# EasyEDA Pro project car.epro, schematic Schematic1
Create Date: 2022-11-29; Page Name: P1; Project Name: STM32F103开发板-板载stlink; Schematic Name: Schematic1; Update Date: 2022-12-02; Company: 嘉立创EDA; Page Size: A3; Version: V1.0
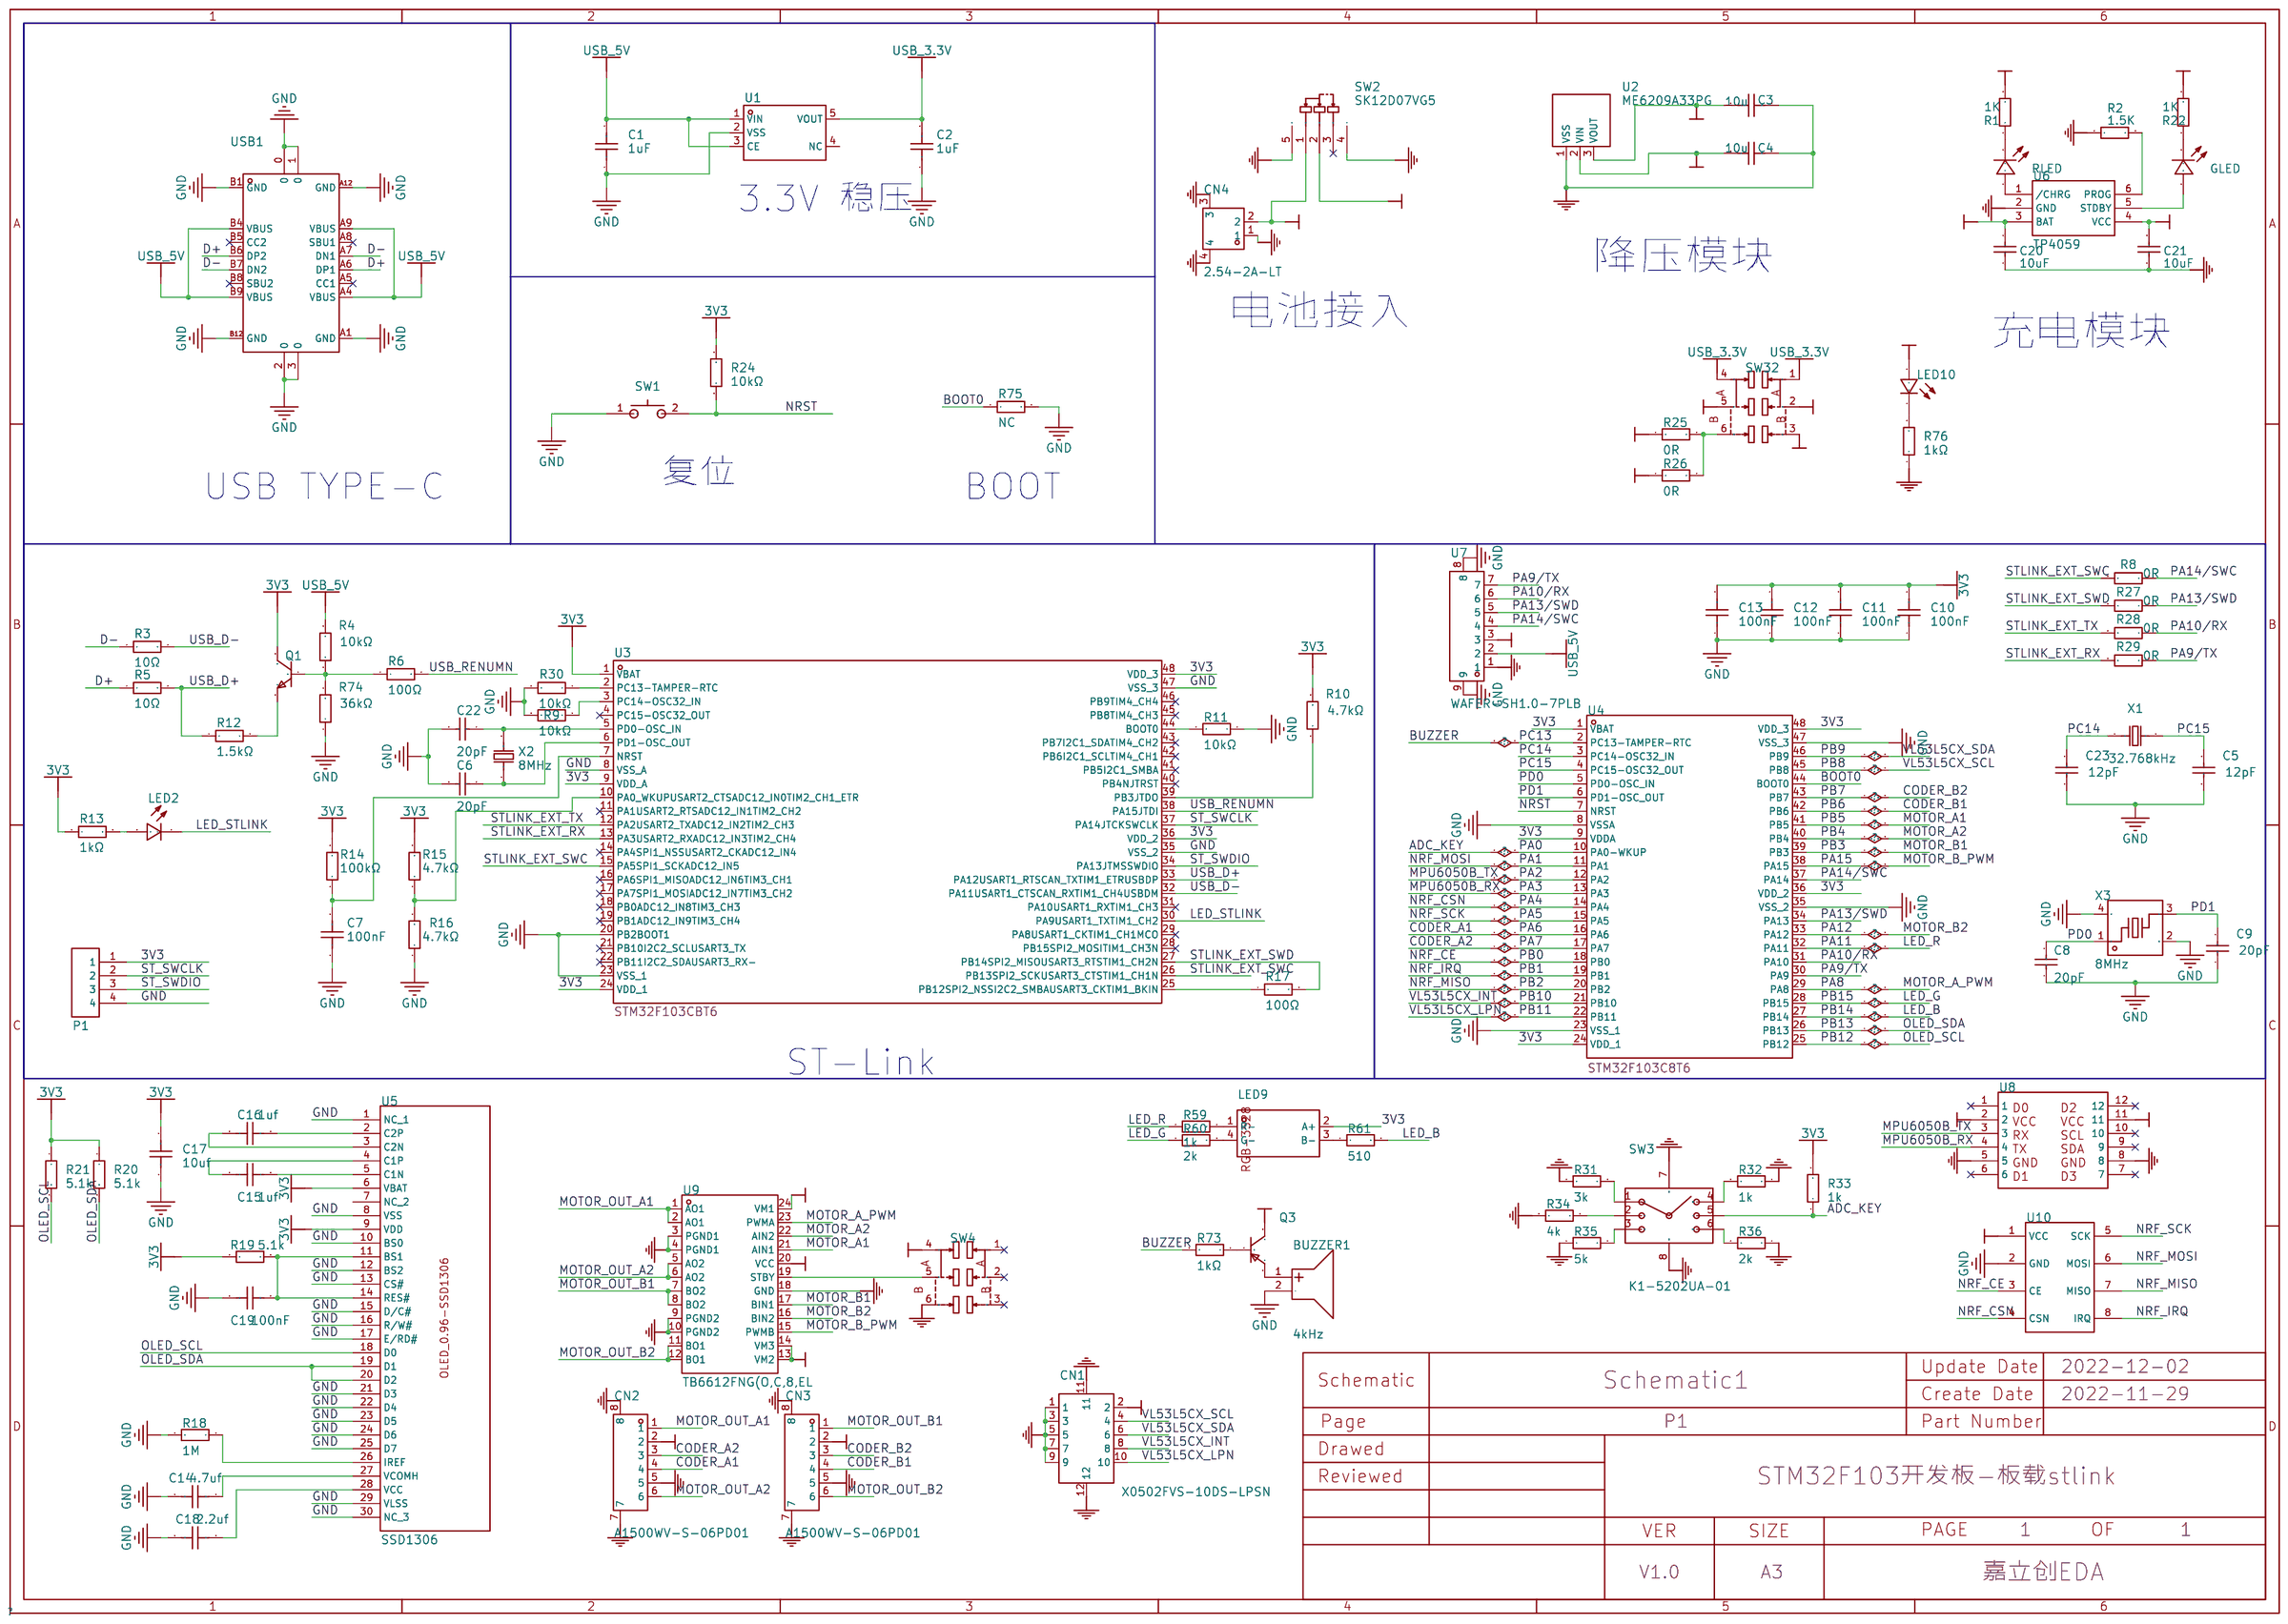
[diagram p0: schematic sheet]

## Parts
BUZZER1  4kHz  [BUZ-SMD_2P-L4.0-W4.0-L_GSC4317YA]
C1  1uF  [C0402]
C2  1uF  [C0402]
C3  10u  [C0603]
C4  10u  [C0603]
C5  12pF  [C0402]
C6  20pF  [C0402]
C7  100nF  [C0402]
C8  20pF  [C0402]
C9  20pF  [C0402]
C10  100nF  [C0402]
C11  100nF  [C0402]
C12  100nF  [C0402]
C13  100nF  [C0402]
C14  4.7uf  [C0402]
C15  1uf  [C0402]
C16  1uf  [C0402]
C17  10uf  [C0603_1]
C18  2.2uf  [C0402]
C19  100nF  [C0402]
C20  10uF  [C0603]
C21  10uF  [C0603]
C22  20pF  [C0402]
C23  12pF  [C0402]
CN1  X0502FVS-10DS-LPSN  [CONN-SMD_10P-P0.50_X0502FVS-10DS-LPSN]
CN2  A1500WV-S-06PD01  [CONN-SMD_6P-P1.50_A1500WV-S-06PD01]
CN3  A1500WV-S-06PD01  [CONN-SMD_6P-P1.50_A1500WV-S-06PD01]
CN4  2.54-2A-LT  [CONN-SMD_2P-P2.54_XH2.54-2AB]
GLED  ORH-G36G  [LED0603-RD]
LED2  NCD0603Y1  [LED0603-RD]
LED9  LED-RGB-3528  [LED 3528-4PIN]
LED10  -  [LED0603-RD]
P1  -  [1.27-4P烧录孔]  (no BOM)
Q1  S8050 J3Y  [SOT-23-3_L3.0-W1.7-P0.95-LS2.9-BR]
Q3  S8550  [SOT-23-3_L2.9-W1.3-P1.90-LS2.4-BR]
R1  1K  [R0402]
R2  1.5K  [R0402]
R3  10Ω  [R0402]
R4  10kΩ  [R0402]
R5  10Ω  [R0402]
R6  100Ω  [R0402]
R8  0R  [R0402]
R9  10kΩ  [R0402]
R10  4.7kΩ  [R0402]
R11  10kΩ  [R0402]
R12  1.5kΩ  [R0402]
R13  1kΩ  [R0402]
R14  100kΩ  [R0402]
R15  4.7kΩ  [R0402]
R16  4.7kΩ  [R0402]
R17  100Ω  [R0402]
R18  1M  [R0402]
R19  5.1k  [R0402]
R20  5.1k  [R0402]
R21  5.1k  [R0402]
R22  1K  [R0402]
R24  10kΩ  [R0402]
R25  0R  [R0603]
R26  0R  [R0603]
R27  0R  [R0402]
R28  0R  [R0402]
R29  0R  [R0402]
R30  10kΩ  [R0402]
R31  3k  [R0402]
R32  1k  [R0402]
R33  1k  [R0402]
R34  4k  [R0402]
R35  5k  [R0402]
R36  2k  [R0402]
R59  1k  [R0402]
R60  2k  [R0402]
R61  510  [R0402]
R73  1kΩ  [R0402]
R74  36kΩ  [R0402]
R75  NC  [R0402]
R76  1kΩ  [R0402]
RLED  ORH-G36G  [LED0603-RD]
SW1  -  [SW-SMD_L3.9-W2.9-P4.15-LS5.0]
SW2  SK12D07VG5  [SW-TH_SK12D07VG5-1]
SW3  K1-5202UA-01  [SW-SMD_K1-5202UA-01]
SW4  MST22D18G2  [SW-SMD_MST22D18G2]
SW32  MST22D18G2  [SW-SMD_MST22D18G2]
U1  XC6210B332MR  [SOT-25_L3.0-W1.6-P0.95-LS2.8-BL]
U2  ME6209A33PG  [SOT-89-3_L4.5-W2.5-P1.50-LS4.2-BR]
U3  STM32F103CBT6  [LQFP-48_L7.0-W7.0-P0.50-LS9.0-BL]
U4  -  [LQFP-48_L7.0-W7.0-P0.50-LS9.0-BL]
U5  SSD1306  [1.3OLED-2]
U6  TP4059  [SOT-23-6_L2.9-W1.6-P0.95-LS2.8-BR]
U7  WAFER-SH1.0-7PLB  [CONN-SMD_7P-P1.00_HC-1.0-7PLT]
U8  -  [JY901S]
U9  TB6612FNG(O,C,8,EL  [SSOP-24_L8.4-W5.8-P0.65-LS7.8-BL]
U10  -  [nrf24f01贴片模块]
USB1  -  [USB-C_SMD-TYPE-C-31-M-12]
X1  32.768kHz  [FC-135R_L3.2-W1.5]
X2  8MHz  [CRYSTAL-SMD_L3.2-W1.5-FC-135R32.7680KF-A3]
X3  8MHz  [CRYSTAL-SMD_4P-L3.2-W2.5-BL]

## Library data of the parts
BUZZER1 = GSC4417YA-16R4000: 驱动方式:无源(外部驱动);构造类型:电磁式;频率:4kHz;声压(SPL):70dB;; LCSC Part Name: 贴片式电磁无源蜂鸣器（外部驱动）; Supplier Part: C255308; Manufacturer: INGHAi(赢海); JLCPCB Part Class: 扩展库; Datasheet: https://item.szlcsc.com/datasheet/GSC4417YA-16R4000/249260.html; Supplier: LCSC; Driver Circuitry: 无源(外部驱动); Technology: 电磁式; Voltage - Supply: 2V~4V; Sound Pressure Level(SPL): 70dB; Length: 4mm; Width: 4mm; Height: 2mm
C1 C2 = CL05A105KA5NQNC: 容值:1uF;精度:±10%;额定电压:25V;材质(温度系数):X5R;; LCSC Part Name: 1uF ±10% 25V; Supplier Part: C52923; Manufacturer: SAMSUNG(三星); Supplier Footprint: 0402; JLCPCB Part Class: Basic Part; Datasheet: https://atta.szlcsc.com/upload/public/pdf/source/20160103/1457707735223.pdf; Supplier: LCSC; Tolerance: ±10%; Voltage Rated: 25V; Temperature Coefficient: X5R
C3 C4 = 10u
C5 C23 = 0402CG120J500NT: 容值:12pF;精度:±5%;额定电压:50V;材质(温度系数):C0G;; LCSC Part Name: 12pF ±5% 50V; Supplier Part: C1547; Manufacturer: FH(风华); Supplier Footprint: 0402; JLCPCB Part Class: Basic Part; Datasheet: https://atta.szlcsc.com/upload/public/pdf/source/20170923/C1547_1506149265711988354.pdf; Supplier: LCSC; Tolerance: ±5%; Voltage Rated: 50V; Temperature Coefficient: C0G
C6 C8 C9 C22 = 0402CG200J500NT: 容值:20pF;精度:±5%;额定电压:50V;材质(温度系数):C0G;; LCSC Part Name: 20pF ±5% 50V; Supplier Part: C1554; Manufacturer: FH(风华); Supplier Footprint: 0402; JLCPCB Part Class: Basic Part; Datasheet: https://atta.szlcsc.com/upload/public/pdf/source/20170923/C1554_1506149268708988361.pdf; Supplier: LCSC; Tolerance: ±5%; Voltage Rated: 50V; Temperature Coefficient: C0G
C7 C10-C13 = CL05B104KB54PNC: 容值:100nF;精度:±10%;额定电压:50V;材质(温度系数):X7R;; LCSC Part Name: 100nF ±10% 50V; Supplier Part: C307331; Manufacturer: SAMSUNG(三星); Supplier Footprint: 0402; JLCPCB Part Class: Basic Part; Datasheet: https://atta.szlcsc.com/upload/public/pdf/source/20181009/C307331_222F7C870FD3EA5F46F538B483443886.pdf; Supplier: LCSC; Tolerance: ±10%; Voltage Rated: 50V; Temperature Coefficient: X7R
C14-C19 = CAP_0603: Supplier Footprint: 0603
C20 C21 = GRM21BB31C106KE15L: Supplier: LCSC; Supplier Part: C162317; Manufacturer: Murata Electronics
CN1 = X0502FVS-10DS-LPSN: PIN总数:10P;间距:0.5mm;安装方式:立贴;排数:2;额定电流:300mA;工作温度:-40℃~+125℃;; LCSC Part Name: PIN:10P 间距:0.5mm 立贴; Supplier Part: C21261238; Manufacturer: XKB Connection(中国星坤); Supplier Footprint: SMD,P=0.5mm; JLCPCB Part Class: Extended Part; Datasheet: https://item.szlcsc.com/datasheet/X0502FVS-10DS-LPSN/22679970.html; Supplier: LCSC; Number of Pins: 10P; Pitch: 0.5mm; Mounting Type: 立贴; Number of Rows: 2; Current Rating: 300mA; Voltage Rating: 100V; Connection Type: 槽型对接; Contact Material: 铜合金; Operating Temperature: -40℃~+125℃
CN2 CN3 = A1500WV-S-06PD01: 插针结构:1x6P;间距:1.5mm;安装方式:立贴;参考系列:-;总PIN数:6P;排数:1;每排PIN数:6;行距:-;额定电流:1A;触头材质:黄铜;触头镀层:金;工作温度:-25℃~+85℃;; LCSC Part Name: 1x6P 间距:1.5mm 立贴; Supplier Part: C360124; Manufacturer: HR(灿达); Supplier Footprint: SMD,P=1.5mm; JLCPCB Part Class: Extended Part; Datasheet: https://item.szlcsc.com/datasheet/A1500WV-S-06PD01/334902.html; Supplier: LCSC; Pins Structure: 1x6P; Pitch: 1.5mm; Mounting Type: 立贴; Number of Pins: 6P; Number of Rows: 1; Number of PINs Per Row: 6; Current Rating: 1A; Contact Material: 黄铜; Contact Plating: 金; Operating Temperature: -25℃~+85℃; Voltage Rating: 100V; Plastic Material: PA6T; Flame Retardant Rating: UL94V-0; Color: 米色; Z-Height of the Board: 6.5mm; Y-Width of Bottom Edge on Board: 4.1mm
CN4 = 2.54-2A-LT: 插针结构:1x2P;间距:2.54mm;安装方式:立贴;参考系列:XH;总PIN数:2P;排数:1;每排PIN数:2;行距:-;额定电流:500mA;触头材质:磷铜;触头镀层:锡;工作温度:-25℃~+85℃;; LCSC Part Name: 1x2P 间距:2.54mm 立贴 系列:XH; Supplier Part: C722695; Manufacturer: CAX(创都); Supplier Footprint: SMD,P=2.54mm; JLCPCB Part Class: Extended Part; Datasheet: https://item.szlcsc.com/datasheet/2.54-2A-LT/766902.html; Supplier: LCSC; Pins Structure: 1x2P; Pitch: 2.54mm; Mounting Type: 立贴; Reference Series: XH; Number of Pins: 2P; Number of Rows: 1; Number of PINs Per Row: 2; Current Rating: 500mA; Contact Material: 磷铜; Contact Plating: 锡; Operating Temperature: -25℃~+85℃; Voltage Rating: 50V; Plastic Material: LCP; Color: 米色; Z-Height of the Board: 7.9mm; Y-Width of Bottom Edge on Board: 6mm
GLED RLED = ORH-G36G: Supplier: LCSC; Supplier Part: C205443; Manufacturer: Orient; JLCPCB Part Class: Extend
LED2 = NCD0603Y1: 发光颜色:黄灯;; LCSC Part Name: 黄灯; Supplier Part: C84268; Manufacturer: 国星光电; Supplier Footprint: 0603; JLCPCB Part Class: Extended Part; Datasheet: https://atta.szlcsc.com/upload/public/pdf/source/20200820/C84268_8FC106CB292CF978F9CFC6892464F83C.pdf; Supplier: LCSC; Emitted Color: 黄灯
LED9 = ?
LED10 = NCD0603G1: 发光颜色:翠绿;; LCSC Part Name: 翠绿; Supplier Part: C84267; Manufacturer: 国星光电; Supplier Footprint: 0603; JLCPCB Part Class: Extended Part; Datasheet: https://atta.szlcsc.com/upload/public/pdf/source/20200820/C84267_04BA7703640BAC111D09F5EFB971FBF3.pdf; Supplier: LCSC; Emitted Color: 翠绿
P1 = 1.27-4P烧录孔
Q1 = S8050 J3Y: 晶体管类型:NPN;集射极击穿电压(Vceo):25V;集电极电流(Ic):500mA;功率(Pd):300mW;集电极-发射极饱和电压(VCE(sat)@Ic,Ib):600mV@500mA,50mA;直流电流增益(hFE@Ic,Vce):200@50mA,1V;特征频率(fT):150MHz;工作温度:+150@(Tj);; LCSC Part Name: S8050 J3Y (200-350) (200-350); Supplier Part: C2146; Manufacturer: CJ（江苏长电/长晶）; Supplier Footprint: SOT-23(SOT-23-3); JLCPCB Part Class: Basic Part; Datasheet: https://atta.szlcsc.com/upload/public/pdf/source/20140809/1457707209234.pdf; Supplier: LCSC; Transistor Type: NPN; Collector-Emitter Breakdown Voltage (Vceo): 25V; Collector Current (Ic): 500mA; Power Dissipation (Pd): 300mW; Collector-Emitter Saturation Voltage (VCE(sat)@Ic,Ib): 600mV@500mA,50mA; DC Current Gain (hFE@Ic,Vce): 200@50mA,1V; Transition Frequency (fT): 150MHz; Operating Temperature: +150@(Tj)
Q3 = S8550_C2891805: Supplier Part: C2891805; Manufacturer: YONGYUTAI(永裕泰); Supplier Footprint: SOT-23; JLCPCB Part Class: 扩展库; Datasheet: https://atta.szlcsc.com/upload/public/pdf/source/20210901/65C3C4D1695A9271DEFEFE0B623CB3B1.pdf; Supplier: LCSC
R1 R2 R22 = RC0603FR-071K5L: Supplier: LCSC; Manufacturer: YAGEO; Supplier Part: C114668
R3 R5 = 0402WGF100JTCE: 电阻类型:厚膜电阻;阻值:10Ω;精度:±1%;功率:62.5mW;温度系数:±200ppm/;最大工作电压:50V;工作温度范围:-55~+155;; LCSC Part Name: 10Ω ±1% 62.5mW; Supplier Part: C25077; Manufacturer: UNI-ROYAL(厚声); Supplier Footprint: 0402; JLCPCB Part Class: Basic Part; Datasheet: https://atta.szlcsc.com/upload/public/pdf/source/20200306/C422600_1E6D84923E4A46A82E41ADD87F860B5C.pdf; Supplier: LCSC; Type: 厚膜电阻; Tolerance: ±1%; Power(Watts): 62.5mW; Temperature Coefficient: ±200ppm/; Overload Voltage (Max): 50V; Operating Temperature Range: -55~+155
R4 R8 R9 R11 R24 R27-R30 R74 = 0402WGF1002TCE: 电阻类型:厚膜电阻;阻值:10kΩ;精度:±1%;功率:62.5mW;温度系数:±100ppm/;最大工作电压:50V;工作温度范围:-55~+155;; LCSC Part Name: 10kΩ ±1% 62.5mW; Supplier Part: C25744; Manufacturer: UNI-ROYAL(厚声); Supplier Footprint: 0402; JLCPCB Part Class: Basic Part; Datasheet: https://atta.szlcsc.com/upload/public/pdf/source/20200306/C422600_1E6D84923E4A46A82E41ADD87F860B5C.pdf; Supplier: LCSC; Type: 厚膜电阻; Tolerance: ±1%; Power(Watts): 62.5mW; Temperature Coefficient: ±100ppm/; Overload Voltage (Max): 50V; Operating Temperature Range: -55~+155
R6 R17 = 0402WGF1000TCE: 电阻类型:厚膜电阻;阻值:100Ω;精度:±1%;功率:62.5mW;温度系数:±200ppm/;最大工作电压:50V;工作温度范围:-55~+155;; LCSC Part Name: 100Ω ±1% 62.5mW; Supplier Part: C25076; Manufacturer: UNI-ROYAL(厚声); Supplier Footprint: 0402; JLCPCB Part Class: Basic Part; Datasheet: https://atta.szlcsc.com/upload/public/pdf/source/20200306/C422600_1E6D84923E4A46A82E41ADD87F860B5C.pdf; Supplier: LCSC; Type: 厚膜电阻; Tolerance: ±1%; Power(Watts): 62.5mW; Temperature Coefficient: ±200ppm/; Overload Voltage (Max): 50V; Operating Temperature Range: -55~+155
R10 R15 R16 = 0402WGF4701TCE: 电阻类型:厚膜电阻;阻值:4.7kΩ;精度:±1%;功率:62.5mW;温度系数:±100ppm/;最大工作电压:50V;工作温度范围:-55~+155;; LCSC Part Name: 4.7kΩ ±1% 62.5mW; Supplier Part: C25900; Manufacturer: UNI-ROYAL(厚声); Supplier Footprint: 0402; JLCPCB Part Class: Basic Part; Datasheet: https://atta.szlcsc.com/upload/public/pdf/source/20200306/C422600_1E6D84923E4A46A82E41ADD87F860B5C.pdf; Supplier: LCSC; Type: 厚膜电阻; Tolerance: ±1%; Power(Watts): 62.5mW; Temperature Coefficient: ±100ppm/; Overload Voltage (Max): 50V; Operating Temperature Range: -55~+155
R12 = 0402WGF1501TCE: 电阻类型:厚膜电阻;阻值:1.5kΩ;精度:±1%;功率:62.5mW;温度系数:±100ppm/;最大工作电压:50V;工作温度范围:-55~+155;; LCSC Part Name: 1.5kΩ ±1% 62.5mW; Supplier Part: C25867; Manufacturer: UNI-ROYAL(厚声); Supplier Footprint: 0402; JLCPCB Part Class: Basic Part; Datasheet: https://atta.szlcsc.com/upload/public/pdf/source/20200306/C422600_1E6D84923E4A46A82E41ADD87F860B5C.pdf; Supplier: LCSC; Type: 厚膜电阻; Tolerance: ±1%; Power(Watts): 62.5mW; Temperature Coefficient: ±100ppm/; Overload Voltage (Max): 50V; Operating Temperature Range: -55~+155
R13 R75 R76 = 0402WGF1001TCE: 电阻类型:厚膜电阻;阻值:1kΩ;精度:±1%;功率:62.5mW;温度系数:±100ppm/;最大工作电压:50V;工作温度范围:-55~+155;; LCSC Part Name: 1kΩ ±1% 62.5mW; Supplier Part: C11702; Manufacturer: UNI-ROYAL(厚声); Supplier Footprint: 0402; JLCPCB Part Class: Basic Part; Datasheet: https://atta.szlcsc.com/upload/public/pdf/source/20200306/C422600_1E6D84923E4A46A82E41ADD87F860B5C.pdf; Supplier: LCSC; Type: 厚膜电阻; Tolerance: ±1%; Power(Watts): 62.5mW; Temperature Coefficient: ±100ppm/; Overload Voltage (Max): 50V; Operating Temperature Range: -55~+155
R14 = 0402WGF1003TCE: 电阻类型:厚膜电阻;阻值:100kΩ;精度:±1%;功率:62.5mW;温度系数:±100ppm/;最大工作电压:50V;工作温度范围:-55~+155;; LCSC Part Name: 100kΩ ±1% 62.5mW; Supplier Part: C25741; Manufacturer: UNI-ROYAL(厚声); Supplier Footprint: 0402; JLCPCB Part Class: Basic Part; Datasheet: https://atta.szlcsc.com/upload/public/pdf/source/20200306/C422600_1E6D84923E4A46A82E41ADD87F860B5C.pdf; Supplier: LCSC; Type: 厚膜电阻; Tolerance: ±1%; Power(Watts): 62.5mW; Temperature Coefficient: ±100ppm/; Overload Voltage (Max): 50V; Operating Temperature Range: -55~+155
R18-R21 = Res_0603: Supplier Footprint: 0603
R25 R26 = Res_0805: Supplier Footprint: 0805
R31-R36 R59-R61 = WR06X1201FTL: Supplier: LCSC; Manufacturer: WALSIN; Resistance: 1.2K; Supplier Part: C163838; JLCPCB Part Class: Extended Part
R73 = 0603WAF1001T5E_1: 电阻类型:厚膜电阻;阻值:1kΩ;精度:±1%;功率:100mW;; LCSC Part Name: 1kΩ ±1% 100mW; Supplier Part: C21190; Manufacturer: UNI-ROYAL(厚声); Manufacturer Part: 0603WAF1001T5E; Supplier Footprint: 0603; JLCPCB Part Class: Basic Part; Datasheet: https://atta.szlcsc.com/upload/public/pdf/source/20200306/C422600_1E6D84923E4A46A82E41ADD87F860B5C.pdf; Supplier: LCSC; Type: 厚膜电阻; Tolerance: ±1%; Power(Watts): 100mW; Temperature Coefficient: ±100ppm/℃; Overload Voltage (Max): 75V; Operating Temperature Range: -55℃~+155℃
SW1 = GT-TC029B-H025-L1N: 触点电流:50mA;额定电压(DC):12V;绝缘电阻:100MΩ;电路结构:单刀单掷;安装方式:立贴;按钮形状:圆形按钮;按钮/盖帽颜色:黑色;带灯:无;作用力:250gf@±30gf;机械寿命:100000;工作温度:-30℃~+85℃;引脚样式:SMD接片;开关长度:3.9mm;开关宽度:2.9mm;开关高度:2.5mm;带支架:否;; LCSC Part Name: 立式两脚小龟H2.5 250gf 无柱; Supplier Part: C843669; Manufacturer: G-Switch(品赞); Supplier Footprint: SMD,3×4×2.5mm; JLCPCB Part Class: Extended Part; Datasheet: https://atta.szlcsc.com/upload/public/pdf/source/20201014/C843665_B07D254A2E90B746498E934B945CCD5F.pdf; Supplier: LCSC; Contact Current: 50mA; Voltage Rating (DC): 12V; Insulation Resistance: 100MΩ; Circuit: 单刀单掷; Mounting Style: 立贴; Actuator Style: 圆形按钮; Actuator/Cap Color: 黑色; With Lamp: 无; Operating Force: 250gf@±30gf; Mechanical Life: 100000; Operating Temperature: -30℃~+85℃; Pin Style: SMD接片; Switch Length: 3.9mm; Switch Width: 2.9mm; Switch Height: 2.5mm; Strike Gundam: 否
SW2 = SK12D07VG5: 电路结构:单刀双掷;安装方式:-;开关颜色:-;额定电流:500mA;额定电压:50V;工作寿命:5千次;; Supplier Part: C431548; Manufacturer: SHOU HAN(首韩); Supplier Footprint: 插件,8.7x4.4mm; JLCPCB Part Class: Extended Part; Datasheet: https://item.szlcsc.com/datasheet/SK12D07VG5/427905.html; Supplier: LCSC; Circuit: 单刀双掷; Termination Style: PC引脚; Length: 8.7mm; Width: 4.4mm; Switch Height: 4.7mm; Current Rating: 500mA; Voltage Rating: 50V; Life: 5千次; Operating Temperature: -10℃~+50℃
SW3 = K1-5202UA-01: Supplier Part: C136710; Manufacturer: 韩国韩荣; Supplier Footprint: SMD,7.5x7.5mm; JLCPCB Part Class: 扩展库; Datasheet: https://atta.szlcsc.com/upload/public/pdf/source/20210810/88783A564DD08671777AA13C042542B2.pdf; Supplier: LCSC
SW4 SW32 = MST22D18G2: 额定电流(DC)：50mA 额定电压(DC)：12V 电路结构：单刀双掷 安装方式：立贴 机械寿命：10000 滑钮形状：矩形柱状 引脚样式：SMD接片 工作温度：-30℃~+80℃ 开关长度：9.1mm 开关宽度：3.6mm 开关高度：3.45mm 柄高：2mm; LCSC Part Name: 两档立式贴片 6脚拨动 柄长2.0MM; Supplier Part: C431544; Manufacturer: SHOU HAN(首韩); Supplier Footprint: SMD,3.6x9.1mm; JLCPCB Part Class: 扩展库; Datasheet: https://atta.szlcsc.com/upload/public/pdf/source/20190925/C431544_D32DFFD935A96A6C5145903882D4ABA1.pdf; Supplier: LCSC
U1 = XC6210B332MR_C424705: 输出类型:固定;输出极性:正;输出通道数:1;最大输入电压:6V;输出电压:3.3V;压差:75mV@(100mA);输出电流:900mA;电源纹波抑制比(PRSS):60dB@(1kHz);; LCSC Part Name: Vin=6V Vout=3.3V 900mA 60dB@(1kHz); Supplier Part: C424705; Manufacturer: TOREX(特瑞仕); Supplier Footprint: SOT-25; JLCPCB Part Class: Extended Part; Datasheet: https://atta.szlcsc.com/upload/public/pdf/source/20190903/C424705_1DFB2113A9A78D399905DBF688657204.pdf; Supplier: LCSC; Output Type: 固定; Output Polarity: 正; Number of Outputs: 1; Maximum Input Voltage: 6V; Output Voltage: 3.3V; Dropout Voltage: 75mV@(100mA); Output Current: 900mA; Power Supply Rejection Ratio (PRSS): 60dB@(1kHz)
U2 = ME6209A33PG: 输出类型:固定;工作电压:18V;输出电压:3.3V;输出电流:250mA;电源纹波抑制比(PSRR):-;输出极性:正极;; LCSC Part Name: 输入18V 输出3.3V 250mA; Supplier Part: C80222; Manufacturer: MICRONE(南京微盟); Supplier Footprint: SOT-89-3; JLCPCB Part Class: Extended Part; Datasheet: https://item.szlcsc.com/datasheet/ME6209A33PG/81367.html; Supplier: LCSC; Output Type: 固定; Voltage - Supply: 18V; Output Voltage: 3.3V; Output Current: 250mA; Voltage Dropout: 80mV@(40mA); standby current: 3uA; Operating Temperature: -40℃~+85℃; Output Configuration: 正极; Number of Outputs: 1
U3 = STM32F103CBT6: 主频（MAX):72MHz;工作电压:2V ~ 3.6V;; Supplier Part: C8304; Manufacturer: ST(意法半导体); Supplier Footprint: LQFP-48_7x7x05P; JLCPCB Part Class: Extended Part; Datasheet: https://atta.szlcsc.com/upload/public/pdf/source/20140724/1457707170379.pdf; Supplier: LCSC; Speed: 72MHz; Voltage - Supply (Vcc/Vdd): 2V ~ 3.6V; RAM Size: 20KB; Number of I/O: 37; A/D: 16x12bit; PWM: 13; UART/USART: 3 USART; I2C（SMBUS/PMBUS）: 2; USB Device: 1; CAN: 1
U4 = STM32F103C8T6: 工作电压:2V ~ 3.6V;CPU位数:32-Bit;CPU内核:ARM® Cortex®-M3;主频（MAX):72MHz;ROM类型:FLASH;; Supplier Part: C8734; Manufacturer: ST(意法半导体); Supplier Footprint: LQFP-48_7x7x05P; JLCPCB Part Class: Basic Part; Datasheet: https://atta.szlcsc.com/upload/public/pdf/source/20140724/1457707174202.pdf; Supplier: LCSC
U5 = SSD1306
U6 = TP4059: 工作电压:4V~9V;最大充电电流:600mA;电池类型:锂离子/聚合物;电池节数:1;; Supplier Part: C80364; Manufacturer: TOPPOWER(南京拓微); Supplier Footprint: SOT-23-6; JLCPCB Part Class: Extended Part; Datasheet: https://item.szlcsc.com/datasheet/TP4059/81510.html; Supplier: LCSC; The Chip Type: 充电芯片; Voltage - Supply: 4V~9V; Charge Current - Max: 600mA; Charging Saturation Voltage: 4.2V; Type of Battery: 锂离子/聚合物; Number of Cells: 1; Operating Temperature: -40℃~+85℃; Supply Current (Iq): 2uA
U7 = WAFER-SH1.0-7PLB: 插针结构:1x7P;间距:1mm;安装方式:立贴;参考系列:SH;总PIN数:7P;排数:1;每排PIN数:7;行距:-;额定电流:1A;触头材质:黄铜;触头镀层:锡;工作温度:-40℃~+85℃;; LCSC Part Name: 1x7P 间距:1mm 立贴 系列:SH; Supplier Part: C3029337; Manufacturer: XUNPU(讯普); Supplier Footprint: SMD,P=1mm; JLCPCB Part Class: Extended Part; Datasheet: https://item.szlcsc.com/datasheet/WAFER-SH1.0-7PLB/3561349.html; Supplier: LCSC; Pins Structure: 1x7P; Pitch: 1mm; Mounting Type: 立贴; Reference Series: SH; Number of Pins: 7P; Number of Rows: 1; Number of PINs Per Row: 7; Current Rating: 1A; Contact Material: 黄铜; Contact Plating: 锡; Operating Temperature: -40℃~+85℃; Voltage Rating: 50V; Plastic Material: LCP; Supplementary Features: 辅助焊脚; Color: 米色; Z-Height of the Board: 4.4mm; X-Length of Bottom Edge on Board (Spacing Line): 9.35mm; Y-Width of Bottom Edge on Board: 3.05mm
U8 = JY901S
U9 = TB6612FNG(O,C,8,EL: 双直流电机驱动器集成电路; Supplier Part: C88224; Manufacturer: TOSHIBA(东芝); Supplier Footprint: SSOP-24-208mil; JLCPCB Part Class: Extended Part; Datasheet: https://item.szlcsc.com/datasheet/TB6612FNG(O%252CC%252C8%252CEL/89402.html; Supplier: LCSC; RDS(on): 500mΩ; Peak Current: 3.2A; Operating Temperature: -20℃~+85℃
U10 = nrf24l01贴片模块
USB1 = TYPE-C-31-M-12: 连接器类型:Type-C;标准:-;公母:母座;触点数量:16;端口数量:1;额定电流 - 电源:250mA;; Supplier Part: C165948; Manufacturer: 韩国韩荣; JLCPCB Part Class: Extended Part; Datasheet: https://atta.szlcsc.com/upload/public/pdf/source/20210111/C2682493_D8CCFED08835E878D16ACCF4460E43B8.pdf; Supplier: LCSC; Connector Type: Type-C; Gender: 母座; Number of Contacts: 16; Number of Ports: 1; Current Rating - Power (Max): 250mA
X1 = Q13FC1350000400: 晶振类型:贴片无源晶振;频率:32.768kHz;频率公差:±20ppm;频率稳定度:-;负载电容:12.5pF;等效串联电阻(ESR):70kΩ;工作温度:-40℃~+85℃;; LCSC Part Name: 32.768kHz ±20ppm 12.5pF; Supplier Part: C32346; Manufacturer: EPSON(爱普生); Supplier Footprint: SMD3215-2P; JLCPCB Part Class: Basic Part; Datasheet: https://atta.szlcsc.com/upload/public/pdf/source/20190108/C32346_746D6B07EAF90824457A96480007685F.pdf; Supplier: LCSC; Crystal Type: 贴片无源晶振; Frequency Tolerance: ±20ppm; Load Capacitance: 12.5pF; Equivalent Series Resistance (ESR): 70kΩ; Operating Temperature: -40℃~+85℃
X2 = FC-135 32.7680KA-E3: 频率:32.768kHz;常温频差:±20ppm;负载电容:6pF;; LCSC Part Name: 32.768kHz ±20ppm 6pF; Supplier Part: C1986360; Manufacturer: EPSON(爱普生); Supplier Footprint: SMD3215-2P; JLCPCB Part Class: Extended Part; Datasheet: https://item.szlcsc.com/datasheet/FC-135%252032.7680KA-E3/2077905.html; Supplier: LCSC; Normal temperature Frequency Tolerance: ±20ppm; Load Capacitance: 6pF; Equivalent Series Resistance(ESR): 70kΩ; Operating Temperature: -40℃~+85℃
X3 = X32258MSB4SI: 晶振类型:贴片无源晶振;频率:8MHz;频率公差:±10ppm;频率稳定度:±30ppm;负载电容:20pF;工作温度:-40℃~+85℃;; LCSC Part Name: 20pF ±10ppm 8MHz; Supplier Part: C2682774; Manufacturer: YXC扬兴科技; Supplier Footprint: SMD3225-4P; JLCPCB Part Class: Extended Part; Datasheet: https://atta.szlcsc.com/upload/public/pdf/source/20210106/C2682774_0CD4FDA5D9DA3FBEEC23BD607A48E4B0.pdf; Supplier: LCSC; Crystal Type: 贴片无源晶振; Frequency Tolerance: ±10ppm; Frequency Stability: ±30ppm; Load Capacitance: 20pF; Operating Temperature: -40℃~+85℃

## Nets
3V3: C10.2 C11.2 C12.2 C13.2 C17.2 CN1.2 CN2.2 CN3.2 LED9.2(A+) LED10.2(A) P1.1 Q1.3(C) Q3.3(C) R10.2 R13.1 R14.2 R15.2 R19.1 R20.1 R21.1 R24.2 R33.2 SW4.4 SW32.2 U3.1(VBAT) U3.9(VDD_A) U3.24(VDD_1) U3.36(VDD_2) U3.48(VDD_3) U4.1(VBAT) U4.9(VDDA) U4.24(VDD_1) U4.36(VDD_2) U4.48(VDD_3) U5.6(VBAT) U5.9(VDD) U7.3 U8.2 U8.11 U9.20(VCC) U10.1(VCC)
GND: BUZZER1.2(-) C1.1 C2.1 C3.1 C4.1 C5.2 C6.2 C7.1 C8.1 C9.1 C10.1 C11.1 C12.1 C13.1 C14.1 C17.1 C18.1 C19.2 C20.1 C21.1 C22.2 C23.1 CN1.1 CN1.3 CN1.5 CN1.7 CN1.9 CN1.11 CN1.12 CN2.5 CN2.7 CN2.8 CN3.5 CN3.7 CN3.8 CN4.1 CN4.3 CN4.4 P1.4 R2.1 R9.2 R11.1 R16.1 R18.1 R30.2 R31.1 R32.1 R34.1 R35.1 R36.1 R74.1 R75.2 R76.1 SW1.1 SW2.4 SW2.5 SW3.7(COMMON) SW3.8(COMMON) SW4.6 U1.2(VSS) U2.1(VSS) U3.8(VSS_A) U3.20(PB2BOOT1) U3.23(VSS_1) U3.35(VSS_2) U3.47(VSS_3) U4.8(VSSA) U4.23(VSS_1) U4.35(VSS_2) U4.47(VSS_3) U5.1(NC) U5.8(VSS) U5.10(BS0) U5.12(BS2) U5.13(CS#) U5.15(D/C#) U5.16(R/W#) U5.17(E/RD#) U5.21(D3) U5.22(D4) U5.23(D5) U5.24(D6) U5.25(D7) U5.29(VLSS) U5.30(NC_3) U6.2(GND) U7.1 U7.8 U7.9 U8.5 U8.8 U9.3(PGND1) U9.4(PGND1) U9.9(PGND2) U9.10(PGND2) U9.18(GND) U10.2(GND) USB1.0 USB1.1(0) USB1.2(0) USB1.3(0) USB1.A1(GND) USB1.A12(GND) USB1.B1(GND) USB1.B12(GND) X3.2(GND) X3.4(GND)
VBAT: C20.2 CN4.2 R1.2 R22.2 SW2.1 U6.3(BAT)
VCC_MOTOR: SW32.5 U9.13(VM2) U9.14(VM3) U9.24(VM1)
ADC_KEY: R33.1 SW3.5(D) U4.10(PA0-WKUP)
BAT_3.3V: C3.2 R25.1 SW32.3 U2.3(VOUT)
BAT_3.7V: C4.2 R26.1 SW2.2 U2.2(VIN)
BOOT0: R75.1 U4.44(BOOT0)
BUZZER: R73.2 U4.2(PC13-TAMPER-RTC)
CODER_A1: CN2.4 U4.16(PA6)
CODER_A2: CN2.3 U4.17(PA7)
CODER_B1: CN3.4 U4.42(PB6)
CODER_B2: CN3.3 U4.43(PB7)
D+: R5.1 USB1.A6(DP1) USB1.B6(DP2)
D-: R3.1 USB1.A7(DN1) USB1.B7(DN2)
LED_B: R61.2 U4.27(PB14)
LED_G: R60.1 U4.28(PB15)
LED_R: R59.1 U4.32(PA11)
LED_STLINK: LED2.1(K) U3.30(PA9USART1_TXTIM1_CH2)
MOTOR_A1: U4.41(PB5) U9.21(AIN1)
MOTOR_A2: U4.40(PB4) U9.22(AIN2)
MOTOR_A_PWM: U4.29(PA8) U9.23(PWMA)
MOTOR_B1: U4.39(PB3) U9.17(BIN1)
MOTOR_B2: U4.33(PA12) U9.16(BIN2)
MOTOR_B_PWM: U4.38(PA15) U9.15(PWMB)
MOTOR_OUT_A1: CN2.1 U9.1(AO1) U9.2(AO1)
MOTOR_OUT_A2: CN2.6 U9.5(AO2) U9.6(AO2)
MOTOR_OUT_B1: CN3.1 U9.7(BO2) U9.8(BO2)
MOTOR_OUT_B2: CN3.6 U9.11(BO1) U9.12(BO1)
MPU6050B_RX: U4.13(PA3) U8.4
MPU6050B_TX: U4.12(PA2) U8.3
NRF_CE: U4.18(PB0) U10.3(CE)
NRF_CSN: U4.14(PA4) U10.4(CSN)
NRF_IRQ: U4.19(PB1) U10.8(IRQ)
NRF_MISO: U4.20(PB2) U10.7(MISO)
NRF_MOSI: U4.11(PA1) U10.6(MOSI)
NRF_SCK: U4.15(PA5) U10.5(SCK)
NRST: R24.1 SW1.2 U4.7(NRST)
OLED_SCL: R21.2 U4.25(PB12) U5.18(D0)
OLED_SDA: R20.2 U4.26(PB13) U5.19(D1) U5.20(D2)
PA9/TX: R29.1 U4.30(PA9) U7.7
PA10/RX: R28.1 U4.31(PA10) U7.6
PA13/SWD: R27.1 U4.34(PA13) U7.5
PA14/SWC: R8.1 U4.37(PA14) U7.4
PB8: CN1.4 U4.45(PB8)
PB9: CN1.6 U4.46(PB9)
PB10: CN1.8 U4.21(PB10)
PB11: CN1.10 U4.22(PB11)
PC14: C23.2 U4.3(PC14-OSC32_IN) X1.1
PC15: C5.1 U4.4(PC15-OSC32_OUT) X1.2
PD0: C8.2 U4.5(PD0-OSC_IN) X3.1
PD1: C9.2 U4.6(PD1-OSC_OUT) X3.3
ST_SWCLK: P1.2 U3.37(PA14JTCKSWCLK)
ST_SWDIO: P1.3 U3.34(PA13JTMSSWDIO)
STLINK_EXT_RX: R29.2 U3.13(PA3USART2_RXADC12_IN3TIM2_CH4)
STLINK_EXT_SWC: R8.2 U3.15(PA5SPI1_SCKADC12_IN5) U3.26(PB13SPI2_SCKUSART3_CTSTIM1_CH1N)
STLINK_EXT_SWD: R17.2 R27.2 U3.27(PB14SPI2_MISOUSART3_RTSTIM1_CH2N)
STLINK_EXT_TX: R28.2 U3.12(PA2USART2_TXADC12_IN2TIM2_CH3)
USB_3.3V: C2.2 SW32.1 SW32.4 U1.5(VOUT)
USB_5V: C1.2 C21.2 R4.2 U1.1(VIN) U1.3(CE) U6.4(VCC) U7.2 USB1.A4(VBUS) USB1.A9(VBUS) USB1.B4(VBUS) USB1.B9(VBUS)
USB_D+: R5.2 R12.1 U3.33(PA12USART1_RTSCAN_TXTIM1_ETRUSBDP)
USB_D-: R3.2 U3.32(PA11USART1_CTSCAN_RXTIM1_CH4USBDM)
USB_RENUMN: R6.2 U3.38(PA15JTDI)
$1N12780: Q1.2(E) R12.2
$1N12782: Q1.1(B) R4.1 R6.1 R74.2
$1N12786: R30.1 U3.2(PC13-TAMPER-RTC)
$1N12787: R9.1 U3.3(PC14-OSC32_IN)
$1N12790: C22.1 U3.5(PD0-OSC_IN) X2.2
$1N12791: C6.1 U3.6(PD1-OSC_OUT) X2.1
$1N12796: R15.1 R16.2 U3.10(PA0_WKUPUSART2_CTSADC12_IN0TIM2_CH1_ETR)
$1N12798: C7.2 R14.1 U3.7(NRST)
$1N12808: R17.1 U3.25(PB12SPI2_NSSI2C2_SMBAUSART3_CKTIM1_BKIN)
$1N12820: R10.1 U3.39(PB3JTDO)
$1N12821: R11.2 U3.44(BOOT0)
$1N12835: LED2.2(A) R13.2
$1N26575: R2.2 U6.6(PROG)
$1N26597: R1.1 RLED.2(K)
$1N26598: GLED.1(A) U6.5(STDBY)
$1N26615: GLED.2(K) R22.1
$1N26644: SW4.5 U9.19(STBY)
$1N26655: R25.2 R26.2 SW32.6
$1N26693: C19.1 R19.2 U5.11(BS1) U5.14(RES#)
$1N26696: C18.2 U5.28(VCC)
$1N26699: C16.2 U5.2(C2P)
$1N26700: C16.1 U5.3(C2N)
$1N26701: C15.1 U5.4(C1P)
$1N26702: C15.2 U5.5(C1N)
$1N26708: C14.2 U5.27(VCOMH)
$1N26709: R18.2 U5.26(IREF)
$1N26733: LED9.3(B-) R61.1
$1N26734: LED9.4(G-) R60.2
$1N26735: LED9.1(R-) R59.2
$1N26741: R36.2 SW3.6(COMMON)
$1N26742: R32.2 SW3.4(CENTER)
$1N26747: R31.2 SW3.1(A)
$1N26748: R35.2 SW3.3(C)
$1N26752: R34.2 SW3.2(B)
$1N26784: Q3.1(B) R73.1
$1N26789: RLED.1(A) U6.1(/CHRG)
$1N26818: BUZZER1.1(+) Q3.2(E)
$1N26823: LED10.1(K) R76.2

Not connected (* = marked no-connect by the designer): SW2 3*; SW4 1* 2* 3*; U1 4(NC); U3 4(PC15-OSC32_OUT)* 11(PA1USART2_RTSADC12_IN1TIM2_CH2)* 14(PA4SPI1_NSSUSART2_CKADC12_IN4)* 16(PA6SPI1_MISOADC12_IN6TIM3_CH1)* 17(PA7SPI1_MOSIADC12_IN7TIM3_CH2)* 18(PB0ADC12_IN8TIM3_CH3)* 19(PB1ADC12_IN9TIM3_CH4)* 21(PB10I2C2_SCLUSART3_TX)* 22(PB11I2C2_SDAUSART3_RX-)* 28(PB15SPI2_MOSITIM1_CH3N)* 29(PA8USART1_CKTIM1_CH1MCO)* 31(PA10USART1_RXTIM1_CH3)* 40(PB4NJTRST)* 41(PB5I2C1_SMBA)* 42(PB6I2C1_SCLTIM4_CH1)* 43(PB7I2C1_SDATIM4_CH2)* 45(PB8TIM4_CH3)* 46(PB9TIM4_CH4)*; U5 7(NC_2); U8 1* 6* 7* 9* 10* 12*; USB1 A5(CC1)* A8(SBU1)* B5(CC2)* B8(SBU2)*

## Notes on the sheet
- 3.3V 稳压
- 降压模块
- 电池接入
- 充电模块
- USB TYPE-C
- 复位
- BOOT
- ST-Link
